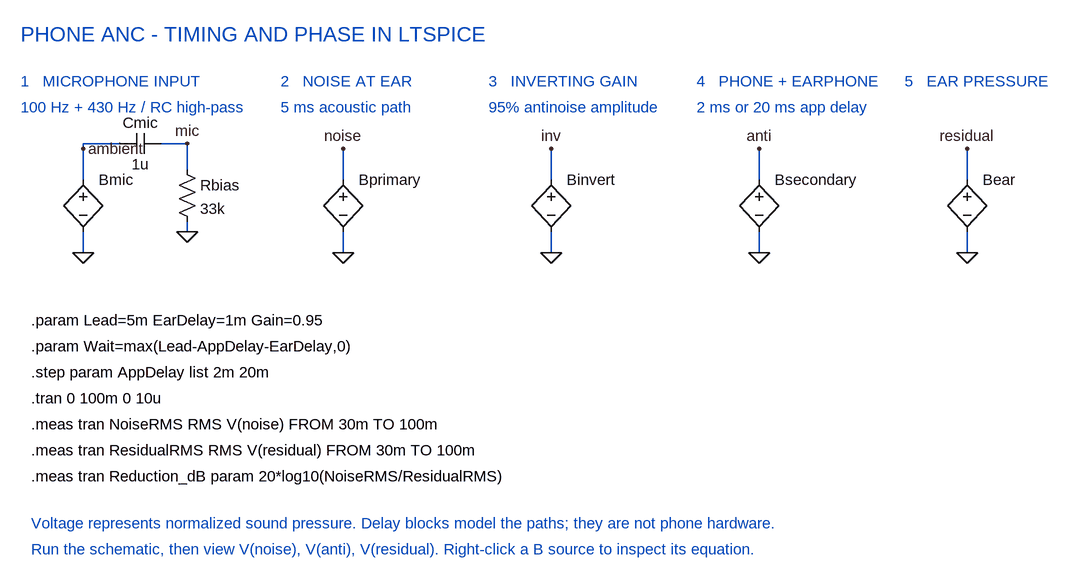
[diagram p0: schematic phone_anc_timing.asc]
phone_anc_timing.asc, the LTspice schematic file:
Version 4
SHEET 1 1920 1100
WIRE 160 216 160 224
WIRE 216 216 160 216
WIRE 320 216 280 216
WIRE 320 256 320 216
WIRE 160 272 160 224
WIRE 560 272 560 224
WIRE 880 272 880 224
WIRE 1200 272 1200 224
WIRE 1520 272 1520 224
WIRE 160 384 160 352
WIRE 320 352 320 336
WIRE 560 384 560 352
WIRE 880 384 880 352
WIRE 1200 384 1200 352
WIRE 1520 384 1520 352
FLAG 160 224 ambient
FLAG 320 216 mic
FLAG 560 224 noise
FLAG 880 224 inv
FLAG 1200 224 anti
FLAG 1520 224 residual
FLAG 160 384 0
FLAG 320 352 0
FLAG 560 384 0
FLAG 880 384 0
FLAG 1200 384 0
FLAG 1520 384 0
SYMBOL bv 160 256 R0
WINDOW 3 0 0 Invisible 0
SYMATTR InstName Bmic
SYMATTR Value V=sin(2*pi*100*time)+0.3*sin(2*pi*430*time)
SYMBOL cap 280 200 R90
WINDOW 0 0 32 VBottom 2
WINDOW 3 32 32 VTop 2
SYMATTR InstName Cmic
SYMATTR Value 1u
SYMBOL res 304 240 R0
SYMATTR InstName Rbias
SYMATTR Value 33k
SYMBOL bv 560 256 R0
WINDOW 3 0 0 Invisible 0
SYMATTR InstName Bprimary
SYMATTR Value V=absdelay(V(ambient),{Lead})
SYMBOL bv 880 256 R0
WINDOW 3 0 0 Invisible 0
SYMATTR InstName Binvert
SYMATTR Value V=-{Gain}*V(mic)
SYMBOL bv 1200 256 R0
WINDOW 3 0 0 Invisible 0
SYMATTR InstName Bsecondary
SYMATTR Value V=absdelay(V(inv),{AppDelay+EarDelay+Wait})
SYMBOL bv 1520 256 R0
WINDOW 3 0 0 Invisible 0
SYMATTR InstName Bear
SYMATTR Value V=V(noise)+V(anti)
TEXT 64 48 Left 3 ;PHONE ANC - TIMING AND PHASE IN LTSPICE
TEXT 64 120 Left 2 ;1   MICROPHONE INPUT
TEXT 464 120 Left 2 ;2   NOISE AT EAR
TEXT 784 120 Left 2 ;3   INVERTING GAIN
TEXT 1104 120 Left 2 ;4   PHONE + EARPHONE
TEXT 1424 120 Left 2 ;5   EAR PRESSURE
TEXT 64 160 Left 2 ;100 Hz + 430 Hz / RC high-pass
TEXT 464 160 Left 2 ;5 ms acoustic path
TEXT 784 160 Left 2 ;95% antinoise amplitude
TEXT 1104 160 Left 2 ;2 ms or 20 ms app delay
TEXT 80 488 Left 2 !.param Lead=5m EarDelay=1m Gain=0.95
TEXT 80 528 Left 2 !.param Wait=max(Lead-AppDelay-EarDelay,0)
TEXT 80 568 Left 2 !.step param AppDelay list 2m 20m
TEXT 80 608 Left 2 !.tran 0 100m 0 10u
TEXT 80 648 Left 2 !.meas tran NoiseRMS RMS V(noise) FROM 30m TO 100m
TEXT 80 688 Left 2 !.meas tran ResidualRMS RMS V(residual) FROM 30m TO 100m
TEXT 80 728 Left 2 !.meas tran Reduction_dB param 20*log10(NoiseRMS/ResidualRMS)
TEXT 80 800 Left 2 ;Voltage represents normalized sound pressure. Delay blocks model the paths; they are not phone hardware.
TEXT 80 840 Left 2 ;Run the schematic, then view V(noise), V(anti), V(residual). Right-click a B source to inspect its equation.

The netlist it stands for:
* phone_anc_timing.asc
Bmic ambient 0 V=sin(2*pi*100*time)+0.3*sin(2*pi*430*time)
Cmic mic ambient 1u
Rbias mic 0 33k
Bprimary noise 0 V=absdelay(V(ambient),{Lead})
Binvert inv 0 V=-{Gain}*V(mic)
Bsecondary anti 0 V=absdelay(V(inv),{AppDelay+EarDelay+Wait})
Bear residual 0 V=V(noise)+V(anti)
* PHONE ANC - TIMING AND PHASE IN LTSPICE
* 1   MICROPHONE INPUT
* 2   NOISE AT EAR
* 3   INVERTING GAIN
* 4   PHONE + EARPHONE
* 5   EAR PRESSURE
* 100 Hz + 430 Hz / RC high-pass
* 5 ms acoustic path
* 95% antinoise amplitude
* 2 ms or 20 ms app delay
.param Lead=5m EarDelay=1m Gain=0.95
.param Wait=max(Lead-AppDelay-EarDelay,0)
.step param AppDelay list 2m 20m
.tran 0 100m 0 10u
.meas tran NoiseRMS RMS V(noise) FROM 30m TO 100m
.meas tran ResidualRMS RMS V(residual) FROM 30m TO 100m
.meas tran Reduction_dB param 20*log10(NoiseRMS/ResidualRMS)
* Voltage represents normalized sound pressure. Delay blocks model the paths; they are not phone hardware.
* Run the schematic, then view V(noise), V(anti), V(residual). Right-click a B source to inspect its equation.
.backanno
.end

* Results of the author's LTspice run, read from the files saved beside the schematic
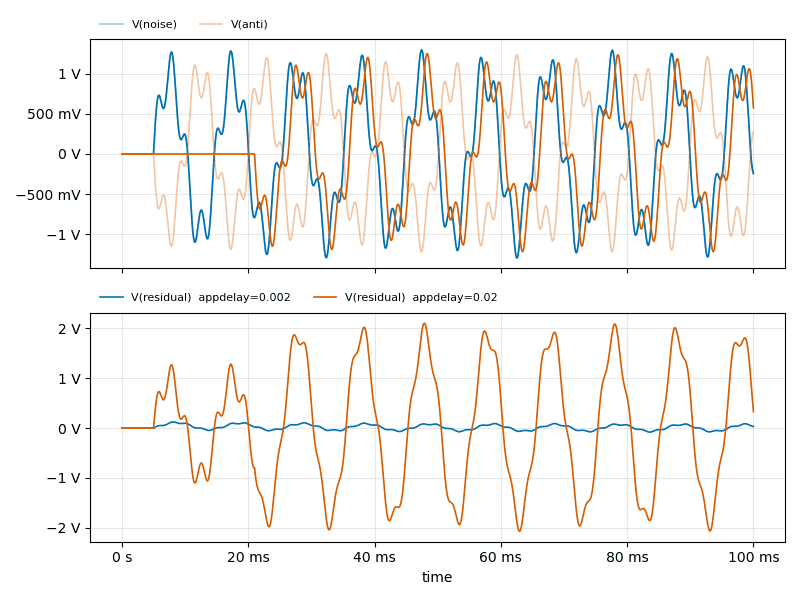
[diagram p1: Transient Analysis of phone_anc_timing.asc, plotted from the saved traces]
* Transient Analysis, 2 runs:
*   V(noise) [appdelay=0.002]: min -1.298 V, max 1.299 V, average 32.27 mV, rms 719.8 mV, last -242.7 mV
*   V(noise) [appdelay=0.02]: min -1.298 V, max 1.299 V, average 32.28 mV, rms 719.9 mV, last -242.7 mV
*   V(anti) [appdelay=0.002]: min -1.22 V, max 1.253 V, average -15.34 mV, rms 682.3 mV, last 277.1 mV
*   V(anti) [appdelay=0.02]: min -1.219 V, max 1.252 V, average 12.19 mV, rms 625.7 mV, last 574.8 mV
*   V(residual) [appdelay=0.002]: min -80.06 mV, max 124.5 mV, average 16.93 mV, rms 53.61 mV, last 34.42 mV
*   V(residual) [appdelay=0.02]: min -2.07 V, max 2.106 V, average 44.47 mV, rms 1.223 V, last 332.1 mV
* From the log:
*   Measurement: noiserms
*     step  RMS(V(noise))  FROM  TO
*        1  0.737843372168  0.03  0.1
*        2  0.737893437725  0.03  0.1
*   Measurement: residualrms
*     step  RMS(V(residual))  FROM  TO
*        1  0.0509352618222  0.03  0.1
*        2  1.32821857784  0.03  0.1
*   Measurement: reduction_db
*     step  20*log10(NoiseRMS/ResidualRMS)
*        1  23.2189127518
*        2  -5.10551804735